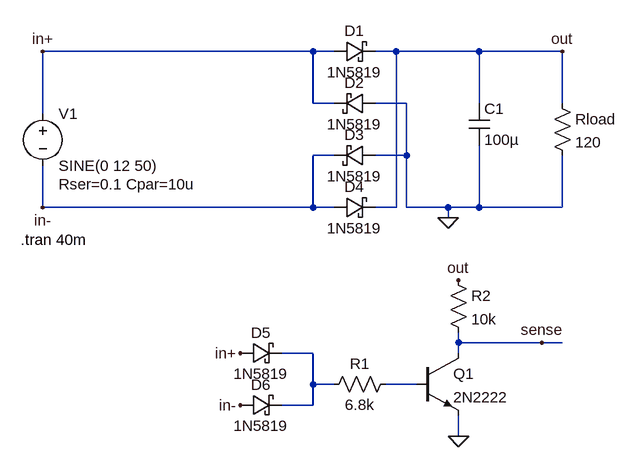
[diagram p0: schematic ac_line_detect.asc]
ac_line_detect.asc, the LTspice schematic file:
Version 4
SHEET 1 880 680
WIRE 320 64 -96 64
WIRE 352 64 320 64
WIRE 448 64 416 64
WIRE 576 64 448 64
WIRE 704 64 576 64
WIRE 320 144 320 64
WIRE 352 144 320 144
WIRE 464 144 416 144
WIRE 576 144 576 64
WIRE 704 144 704 64
WIRE -96 160 -96 64
WIRE 352 224 320 224
WIRE 464 224 464 144
WIRE 464 224 416 224
WIRE -96 304 -96 240
WIRE 320 304 320 224
WIRE 320 304 -96 304
WIRE 352 304 320 304
WIRE 448 304 448 64
WIRE 448 304 416 304
WIRE 464 304 464 224
WIRE 528 304 464 304
WIRE 576 304 576 208
WIRE 576 304 528 304
WIRE 704 304 704 224
WIRE 704 304 576 304
WIRE 528 320 528 304
WIRE 544 512 544 496
WIRE 672 512 544 512
WIRE 704 512 672 512
WIRE 320 528 272 528
WIRE 544 528 544 512
WIRE 320 576 320 528
WIRE 352 576 320 576
WIRE 480 576 432 576
WIRE 320 608 320 576
WIRE 320 608 272 608
WIRE 544 656 544 624
FLAG 528 320 0
FLAG -96 64 in+
FLAG 704 64 out
FLAG -96 304 in-
FLAG 208 608 in-
FLAG 208 528 in+
FLAG 544 656 0
FLAG 544 416 out
FLAG 672 512 sense
SYMBOL voltage -96 144 R0
WINDOW 123 0 0 Left 2
WINDOW 39 24 124 Left 2
SYMATTR InstName V1
SYMATTR Value SINE(0 12 50)
SYMATTR SpiceLine Rser=0.1 Cpar=10u
SYMBOL schottky 352 80 R270
WINDOW 0 32 32 VTop 2
WINDOW 3 0 32 VBottom 2
SYMATTR InstName D1
SYMATTR Value 1N5819
SYMATTR Description Diode
SYMATTR Type diode
SYMBOL schottky 416 128 R90
WINDOW 0 0 32 VBottom 2
WINDOW 3 32 32 VTop 2
SYMATTR InstName D2
SYMATTR Value 1N5819
SYMATTR Description Diode
SYMATTR Type diode
SYMBOL schottky 416 208 R90
WINDOW 0 0 32 VBottom 2
WINDOW 3 32 32 VTop 2
SYMATTR InstName D3
SYMATTR Value 1N5819
SYMATTR Description Diode
SYMATTR Type diode
SYMBOL schottky 352 320 R270
WINDOW 0 32 32 VTop 2
WINDOW 3 0 32 VBottom 2
SYMATTR InstName D4
SYMATTR Value 1N5819
SYMATTR Description Diode
SYMATTR Type diode
SYMBOL cap 560 144 R0
SYMATTR InstName C1
SYMATTR Value 100µ
SYMATTR SpiceLine Rser=0.2
SYMBOL res 688 128 R0
SYMATTR InstName Rload
SYMATTR Value 120
SYMBOL schottky 208 544 R270
WINDOW 0 32 32 VTop 2
WINDOW 3 0 32 VBottom 2
SYMATTR InstName D5
SYMATTR Value 1N5819
SYMATTR Description Diode
SYMATTR Type diode
SYMBOL schottky 208 624 R270
WINDOW 0 32 32 VTop 2
WINDOW 3 0 32 VBottom 2
SYMATTR InstName D6
SYMATTR Value 1N5819
SYMATTR Description Diode
SYMATTR Type diode
SYMBOL res 448 560 R90
WINDOW 0 0 56 VBottom 2
WINDOW 3 32 56 VTop 2
SYMATTR InstName R1
SYMATTR Value 6.8k
SYMBOL npn 480 528 R0
SYMATTR InstName Q1
SYMATTR Value 2N2222
SYMBOL res 528 400 R0
SYMATTR InstName R2
SYMATTR Value 10k
TEXT -130 354 Left 2 !.tran 40m

The netlist it stands for:
* ac_line_detect.asc
V1 in+ in- SINE(0 12 50) Rser=0.1 Cpar=10u
D1 in+ out 1N5819
D2 0 in+ 1N5819
D3 0 in- 1N5819
D4 in- out 1N5819
C1 out 0 100µ Rser=0.2
Rload out 0 120
D5 in+ N001 1N5819
D6 in- N001 1N5819
R1 N002 N001 6.8k
Q1 sense N002 0 0 2N2222
R2 out sense 10k
.model D D
.lib standard.dio
.model NPN NPN
.model PNP PNP
.lib standard.bjt
.tran 40m
.backanno
.end